# EAGLE schematic ecad-transmitter-v4-transmitter-v4-sch (EAGLE 9.7.0)
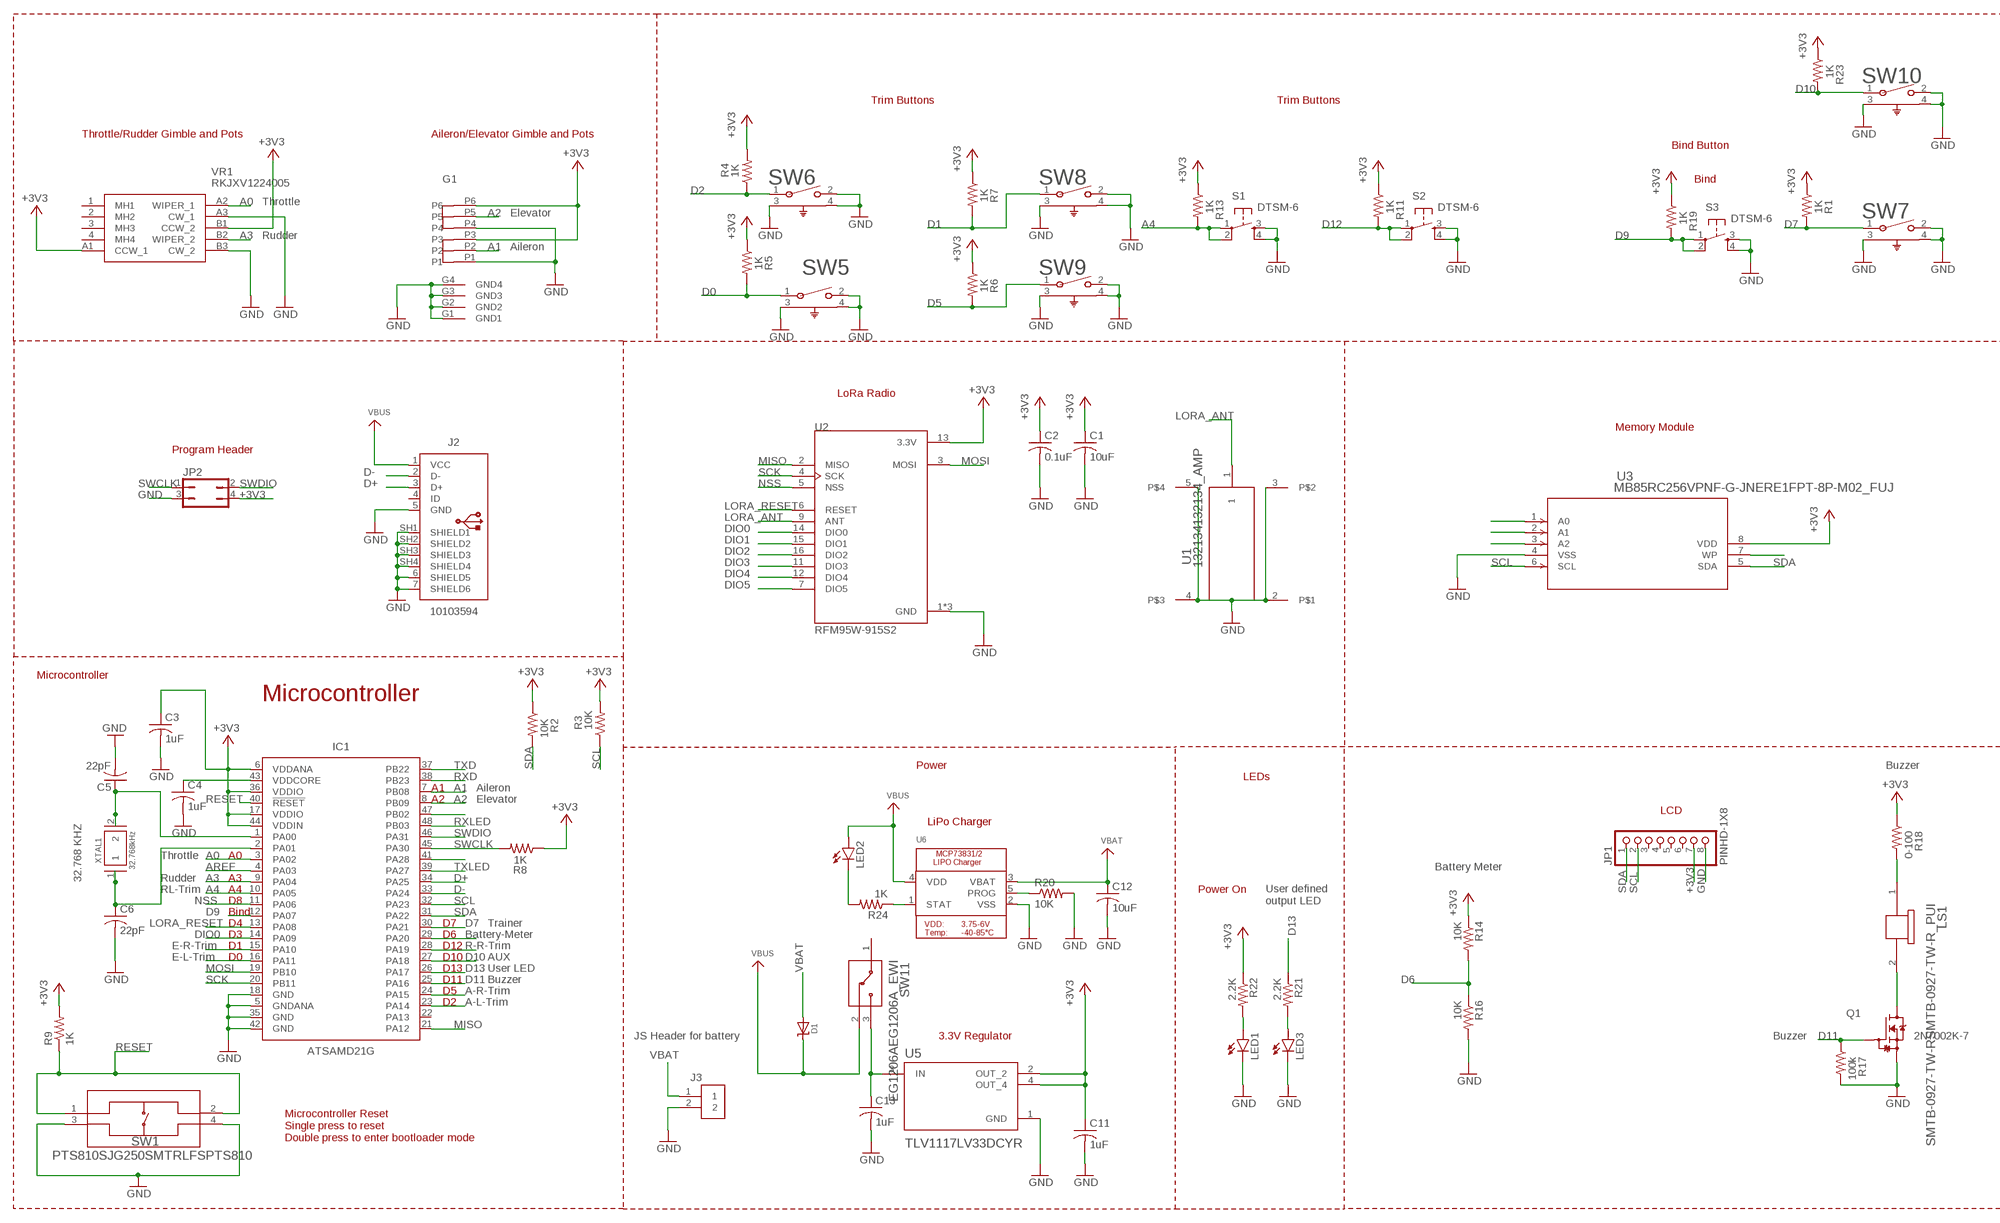
[diagram p0: schematic, sheet 1, part 1 of 2]
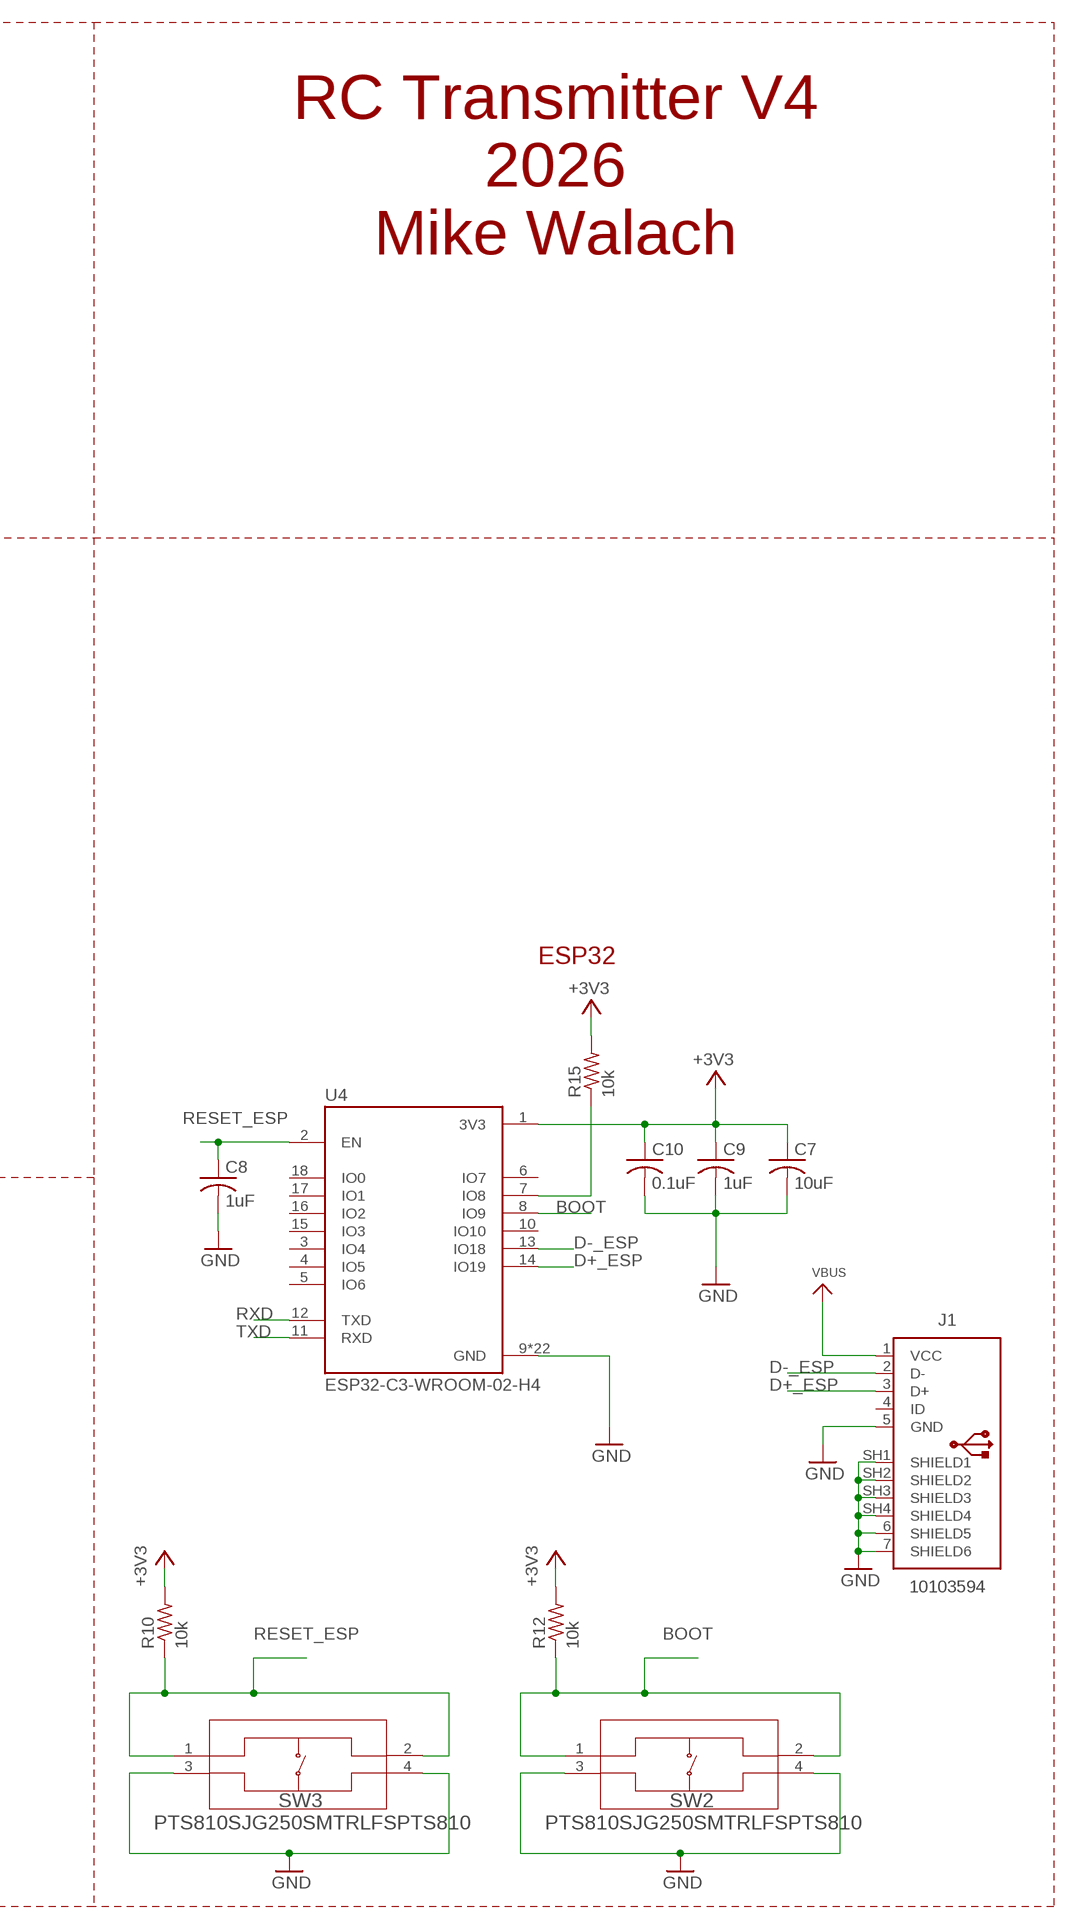
[diagram p1: schematic, sheet 1, part 2 of 2]

## Parts
C1  10uF  C-USC0805  [C0805]
C2  0.1uF  C-USC0805  [C0805]
C3  1uF  C-USC0805  [C0805]
C4  1uF  C-USC0805  [C0805]
C5  22pF  C-USC0805  [C0805]
C6  22pF  C-USC0805  [C0805]
C7  10uF  C-USC0805  [C0805]
C8  1uF  C-USC0805  [C0805]
C9  1uF  C-USC0805  [C0805]
C10  0.1uF  C-USC0805  [C0805]
C11  1uF  C-USC0805  [C0805]
C12  10uF  C-USC0805  [C0805]
C13  1uF  C-USC0805  [C0805]
D1  MICROBUILDER_DIODE-SCHOTTKYSOD-123  [MICROBUILDER_SOD-123]
G1  C37323742  [C37323742]
IC1  ATSAMD21G  ATSAMD21G_TQFP  [QFP50P900X900X120-48]
J1  10103594  [10103594]
J2  10103594  [10103594]
J3  S2B-PH-K-S(LF)(SN)  [S2B-PH-K-S(LF)(SN)]
JP1  PINHD-1X8  [1X08]
JP2  JP2Q  [JP2Q]
LED1  LEDSML0805  [SML0805]
LED2  LEDSML0805  [SML0805]
LED3  LEDSML0805  [SML0805]
LS1  SMTB-0927-TW-RSMTB-0927-TW-R_PUI  [SMTB-0927-TW-R_PUI]
Q1  2N7002K-7  [SOT91P240X110-3N]
R1  1K  R-US_R0805  [R0805]
R2  10K  R-US_R0805  [R0805]
R3  10K  R-US_R0805  [R0805]
R4  1K  R-US_R0805  [R0805]
R5  1K  R-US_R0805  [R0805]
R6  1K  R-US_R0805  [R0805]
R7  1K  R-US_R0805  [R0805]
R8  1K  R-US_R0805  [R0805]
R9  1K  R-US_R0805  [R0805]
R10  10k  R-US_R0805  [R0805]
R11  1K  R-US_R0805  [R0805]
R12  10k  R-US_R0805  [R0805]
R13  1K  R-US_R0805  [R0805]
R14  10K  R-US_R0805  [R0805]
R15  10k  R-US_R0805  [R0805]
R16  10K  R-US_R0805  [R0805]
R17  100k  R-US_R0805  [R0805]
R18  0-100  R-US_R0805  [R0805]
R19  1K  R-US_R0805  [R0805]
R20  10K  R-US_R0805  [R0805]
R21  2.2K  R-US_R0805  [R0805]
R22  2.2K  R-US_R0805  [R0805]
R23  1K  R-US_R0805  [R0805]
R24  1K  R-US_R0805  [R0805]
S1  DTSM-6  [DTSM-6]
S2  DTSM-6  [DTSM-6]
S3  DTSM-6  [DTSM-6]
SW1  PTS810SJG250SMTRLFSPTS810  [PTS810]
SW2  PTS810SJG250SMTRLFSPTS810  [PTS810]
SW3  PTS810SJG250SMTRLFSPTS810  [PTS810]
SW5  1825027-8SW2_1825027-C_TEC  [SW2_1825027-C_TEC]
SW6  1825027-8SW2_1825027-C_TEC  [SW2_1825027-C_TEC]
SW7  1825027-8SW2_1825027-C_TEC  [SW2_1825027-C_TEC]
SW8  1825027-8SW2_1825027-C_TEC  [SW2_1825027-C_TEC]
SW9  1825027-8SW2_1825027-C_TEC  [SW2_1825027-C_TEC]
SW10  1825027-8SW2_1825027-C_TEC  [SW2_1825027-C_TEC]
SW11  EG1206AEG1206A_EWI  [EG1206A_EWI]
U1  132134132134_AMP  [132134_AMP]
U2  RFM95W-915S2  [XCVR_RFM95W-915S2]
U3  MB85RC256VPNF-G-JNERE1FPT-8P-M02_FUJ  [FPT-8P-M02_FUJ]
U4  ESP32-C3-WROOM-02-H4  [MODULE_ESP32-C3-WROOM-02-H4]
U5  TLV1117LV33DCYR  [VREG_TLV1117LV33DCYR]
U6  MICROBUILDER_MCP73831/2  [MICROBUILDER_SOT23-5]
VR1  RKJXV1224005  [RKJXV1224005]
XTAL1  32.768kHz  ABSO7  [XTAL_ABS07-32.768KHZ-T]

## Nets
+3V3: C1.1 C2.1 C3.1 C7.1 C9.1 C10.1 C11.1 G1.P3 G1.P6 IC1.6(VDDANA) IC1.17(VDDIO) IC1.36(VDDIO) IC1.44(VDDIN) JP1.7 JP2.4 R1.1 R2.1 R3.2 R4.2 R5.1 R6.1 R7.1 R8.1 R9.2 R10.2 R11.1 R12.2 R13.1 R14.1 R15.2 R18.1 R19.1 R22.1 R23.1 U2.13(3.3V) U3.8(VDD) U4.1(3V3) U5.2(OUT_2) U5.4(OUT_4) VR1.A1(CCW_1) VR1.B1(CCW_2)
A0: IC1.3(PA02) VR1.A2(WIPER_1)
A1: G1.P2 IC1.7(PB08)
A2: G1.P5 IC1.8(PB09)
A3: IC1.9(PA04) VR1.B2(WIPER_2)
A4: IC1.10(PA05) R13.2 S1.1 S1.2
AREF: IC1.4(PA03)
BOOT: R12.1 SW2.1 SW2.2 U4.8(IO9)
D0: IC1.16(PA11) R5.2 SW5.1
D1: IC1.15(PA10) R7.2 SW8.1
D2: IC1.23(PA14) R4.1 SW6.1
D5: IC1.24(PA15) R6.2 SW9.1
D6: IC1.29(PA20) R14.2 R16.1
D7: IC1.30(PA21) R1.2 SW7.1
D9: IC1.12(PA07) R19.2 S3.1 S3.2
D10: IC1.27(PA18) R23.2 SW10.1
D11: IC1.25(PA16) Q1.1(G) R17.1
D12: IC1.28(PA19) R11.2 S2.1 S2.2
D13: IC1.26(PA17) R21.1
D+: IC1.34(PA25) J2.3(D+)
D+_ESP: J1.3(D+) U4.14(IO19)
D-: IC1.33(PA24) J2.2(D-)
D-_ESP: J1.2(D-) U4.13(IO18)
DIO0: IC1.14(PA09) U2.14(DIO0)
DIO1: U2.15(DIO1)
DIO2: U2.16(DIO2)
DIO3: U2.11(DIO3)
DIO4: U2.12(DIO4)
DIO5: U2.7(DIO5)
GND: C1.2 C2.2 C3.2 C4.2 C5.2 C6.2 C7.2 C8.2 C9.2 C10.2 C11.2 C12.2 C13.2 G1.G1(GND1) G1.G2(GND2) G1.G3(GND3) G1.G4(GND4) G1.P1 G1.P4 IC1.5(GNDANA) IC1.18(GND) IC1.35(GND) IC1.42(GND) J1.5(GND) J1.6(SHIELD5) J1.7(SHIELD6) J1.SH1(SHIELD1) J1.SH2(SHIELD2) J1.SH3(SHIELD3) J1.SH4(SHIELD4) J2.5(GND) J2.6(SHIELD5) J2.7(SHIELD6) J2.SH1(SHIELD1) J2.SH2(SHIELD2) J2.SH3(SHIELD3) J2.SH4(SHIELD4) J3.2 JP1.8 JP2.3 LED1.C LED3.C Q1.2(S) R16.2 R17.2 R20.2 S1.3 S1.4 S2.3 S2.4 S3.3 S3.4 SW1.3 SW1.4 SW2.3 SW2.4 SW3.3 SW3.4 SW5.2 SW5.3 SW5.4 SW6.2 SW6.3 SW6.4 SW7.2 SW7.3 SW7.4 SW8.2 SW8.3 SW8.4 SW9.2 SW9.3 SW9.4 SW10.2 SW10.3 SW10.4 U1.2 U1.3 U1.4 U1.5 U2.1(GND) U2.8(GND) U2.10(GND) U3.4(VSS) U4.9(GND) U4.19(GND) U4.20(GND) U4.21(GND) U4.22(GND) U4.23(GND) U4.24(GND) U4.25(GND) U4.26(GND) U4.27(GND) U4.28(GND) U4.29(GND) U4.30(GND) U4.31(GND) U4.32(GND) U4.33(GND) U4.34(GND) U4.35(GND) U4.36(GND) U4.37(GND) U4.38(GND) U4.39(GND) U5.1(GND) U6.2(VSS) VR1.A3(CW_1) VR1.B3(CW_2)
LORA_ANT: U1.1 U2.9(ANT)
LORA_RESET: IC1.13(PA08) U2.6(RESET)
MISO: IC1.21(PA12) U2.2(MISO)
MOSI: IC1.19(PB10) U2.3(MOSI)
N$1: IC1.47(PB02)
N$2: C4.1 IC1.43(VDDCORE)
N$3: IC1.41(PA28)
N$4: LS1.1 R18.2
N$5: R24.1 U6.1(STAT)
N$6: LS1.2 Q1.3(D)
N$7: LED2.C R24.2
N$8: LED3.A R21.2
N$9: U3.7(WP)
N$10: R20.1 U6.5(PROG)
N$11: U3.3(A2)
N$12: C6.1 IC1.2(PA01) XTAL1.1
N$13: U3.2(A1)
N$14: U3.1(A0)
N$15: C5.1 IC1.1(PA00) XTAL1.2
N$16: C13.1 SW11.3 U5.3(IN)
N$17: R15.1 U4.7(IO8)
N$30: LED1.A R22.2
NSS: IC1.11(PA06) U2.5(NSS)
RESET: IC1.40(!RESET) R9.1 SW1.1 SW1.2
RESET_ESP: C8.1 R10.1 SW3.1 SW3.2 U4.2(EN)
RXD: IC1.38(PB23) U4.12(TXD)
RXLED: IC1.48(PB03)
SCK: IC1.20(PB11) U2.4(SCK)
SCL: IC1.32(PA23) JP1.2 R3.1 U3.6(SCL)
SDA: IC1.31(PA22) JP1.1 R2.2 U3.5(SDA)
SWCLK: IC1.45(PA30) JP2.1 R8.2
SWDIO: IC1.46(PA31) JP2.2
TXD: IC1.37(PB22) U4.11(RXD)
TXLED: IC1.39(PA27)
VBAT: C12.1 D1.A J3.1 U6.3(VBAT)
VBUS: D1.C J1.1(VCC) J2.1(VCC) LED2.A SW11.2 U6.4(VDD)
Unconnected: IC1.22(PA13) J1.4(ID) J2.4(ID) JP1.3 JP1.4 JP1.5 JP1.6 SW11.1 U4.3(IO4) U4.4(IO5) U4.5(IO6) U4.6(IO7) U4.10(IO10) U4.15(IO3) U4.16(IO2) U4.17(IO1) U4.18(IO0) VR1.1(MH1) VR1.2(MH2) VR1.3(MH3) VR1.4(MH4)

## Notes on the sheet
- Trim Buttons | Trim Buttons
- RC Transmitter V4
  2026
  Mike Walach
- Throttle/Rudder Gimble and Pots | Aileron/Elevator Gimble and Pots
- Bind Button
- G1 | Bind
- Throttle
- Elevator
- Rudder
- Aileron
- LoRa Radio
- Memory Module
- Program Header
- ESP32
- Microcontroller
- Microcontroller
- Power | Buzzer
- LEDs
- A1 | Aileron
- A2 | Elevator
- LCD
- LiPo Charger
- Throttle | A0
- Battery Meter
- 32.768 KHZ | Rudder | A3
- RL-Trim | A4 | Power On
- D8
- User defined 
  output LED
- Bind
- D4 | D7 | Trainer
- D3 | D6 | Battery-Meter
- E-R-Trim | D1 | D12 | R-R-Trim
- E-L-Trim | D0 | D10 | AUX
- D13 | User LED
- D11 | Buzzer
- D5 | A-R-Trim
- D2 | A-L-Trim
- JS Header for battery | 3.3V Regulator | Buzzer
- Microcontroller Reset
  Single press to reset
  Double press to enter bootloader mode

## Library data of the parts
C1-C13 = rcl:C-US: CAPACITOR, American symbol; SPICEPREFIX: C
D1 = flightcomputer-2023:MICROBUILDER_DIODE-SCHOTTKY
G1 = C37323742:C37323742
IC1 = IC_Embedded:ATSAMD21G*: 32-bit ARM-Based Microcontrollers Datasheet <http://ww1.microchip.com/downloads/en/devicedoc/40001884a.pdf> Note:For this part User needs to add thermal via in thermal pad in QFN package while designing a board.; CATEGORY: IC_Embedded; CORE: ARM Cortex M0+; DESCRIPTION: Low-power, high-performance Microchip's ARM® Cortex®-M0+ based flash microcontroller; MANUFACTURER: Microchip Technology; MPN: ATSAMD21G; OPERATING_TEMP: variable; PACKAGE: TQFP-48; PART_STATUS: Active; ROHS_COMPLIANT: COMPLIANT; SERIES: SAM D21G; SUB-CATEGORY: Microcontroller; TYPE: 32 bit Microcontroller
J1 J2 = Connector_USB:10103594: USB(2.0) Micro-B, RCPT, 5POS, SMD-THT-R/A Datasheet <https://cdn.amphenol-icc.com/media/wysiwyg/files/documentation/datasheet/inputoutput/io_usb_micro.pdf> Drawing <https://cdn.amphenol-icc.com/media/wysiwyg/files/drawing/10103594.pdf>; CATEGORY: Connectors; CONTACTS: 5; CURRENT-RATING: 1.8A; DESCRIPTION: CONN RCPT USB2.0 MICRO B SMD R/A; GENDER: Receptacle; MANUFACTURER: Amphenol ICC (FCI); MOUNT_TYPE: R/A; MPN: 10103594-0001LF; OPERATING_TEMPERATURE: -30°C ~ 80°C; PART_STATUS: ACTIVE; ROHS_COMPLIANT: COMPLIANT; SUB_CATEGORY: USB; TYPE: USB-micro B; VOLTAGE-RATING: 100VAC
J3 = Connectors:S2B-PH-K-S(LF)(SN): CONN HEADER R/A 2POS 2MM Manufacturer's datasheet <http://www.jst-mfg.com/product/pdf/eng/ePH.pdf>; CREATED_BY: PCBLayout.com; DIGI_KEY_PART_NUMBER: 455-1719-ND; MANUFACTURER: JST Sales America Inc.; MPN: S2B-PH-K-S(LF)(SN)
JP1 = Connector:PINHD-1X8: PIN HEADER; CATEGORY: Headers; DESCRIPTION: Header, Straight, 8 Position; MANUFACTURER: Generic; MPN: Generic; OPERATING_TEMPERATURE: Generic; PART_STATUS: Active; PITCH: 0.100" (2.54mm); ROHS_COMPLIANCE: Generic; SERIES: Generic; SUB-CATEGORY: Headers, Male Pins; TYPE: Board to Board or Cable, Unshrouded, Through Hole, Straight
JP2 = jumper:JP2Q: JUMPER
LED1-LED3 = led:LED: LED OSRAM: - CHIPLED LG R971, LG N971, LY N971, LG Q971, LY Q971, LO R971, LY R971 LH N974, LH R974 LS Q976, LO Q976, LY Q976 LO Q996 - Hyper CHIPLED LW Q18S LB Q993, LB Q99A, LB R99A - SideLED LS A670, LO A670, LY A670, LG A670, LP A670 LB A673, LV A673, LT A673, LW A673 LH A674 LY A675 LS A676, LA A676, LO A676, LY A676, LW A676 LS A679, LY A679, LG A679 - Hyper Micro SIDELED® LS Y876, LA Y876, LO Y876, LY Y876 LT Y87S - SmartLED LW L88C, LW L88S LB L89C, LB L89S, LG L890 LS L89K, LO L89K, LY L89K LS L896, LA L896, LO L896, LY L896 - TOPLED LS T670, LO T670, LY T670, LG T670, LP T670 LSG T670, LSP T670, LSY T670, LOP T670, LYG T670 LG T671, LOG T671, LSG T671 LB T673, LV T673, LT T673, LW T673 LH T674 LS T676, LA T676, LO T676, LY T676, LB T676, LH T676, LSB T676, LW T676 LB T67C, LV T67C, LT T67C, LS T67K, LO T67K, LY T67K, LW E67C LS E67B, LA E67B, LO E67B, LY E67B, LB E67C, LV E67C, LT E67C LW T67C LS T679, LY T679, LG T679 LS T770, LO T770, LY T770, LG T770, LP T770 LB T773, LV T773, LT T773, LW T773 LH T774 LS E675, LA E675, LY E675, LS T675 LS T776, LA T776, LO T776, LY T776, LB T776 LHGB T686 LT T68C, LB T68C - Hyper Mini TOPLED® LB M676 - Mini TOPLED Santana® LG M470 LS M47K, LO M47K, LY M47K Source: http://www.osram.convergy.de LUXEON: - LUMILED® LXK2-PW12-R00, LXK2-PW12-S00, LXK2-PW14-U00, LXK2-PW14-V00 LXK2-PM12-R00, LXK2-PM12-S00, LXK2-PM14-U00 LXK2-PE12-Q00, LXK2-PE12-R00, LXK2-PE12-S00, LXK2-PE14-T00, LXK2-PE14-U00 LXK2-PB12-K00, LXK2-PB12-L00, LXK2-PB12-M00, LXK2-PB14-N00, LXK2-PB14-P00, LXK2-PB14-Q00 LXK2-PR12-L00, LXK2-PR12-M00, LXK2-PR14-Q00, LXK2-PR14-R00 LXK2-PD12-Q00, LXK2-PD12-R00, LXK2-PD12-S00 LXK2-PH12-R00, LXK2-PH12-S00 LXK2-PL12-P00, LXK2-PL12-Q00, LXK2-PL12-R00 Source: www.luxeon.com KINGBRIGHT: KA-3528ASYC Source: www.kingbright.com
LS1 = 2026-06-20_23-40-30_Library:SMTB-0927-TW-R; COPYRIGHT: Copyright (C) 2026 Ultra Librarian. All rights reserved.; MANUFACTURER_NAME: PUI Audio; MANUFACTURER_PART_NUMBER: SMTB-0927-TW-R
Q1 = 2N7002K-7:2N7002K-7: 2N7002K Series 60 V 2 Ohm SMT N-Channel Enhancement Mode Mosfet - SOT-23-3; MANUFACTURER: Diodes Inc.; MAXIMUM_PACKAGE_HIEGHT: 1.1mm; PARTREV: 15-2; STANDARD: IPC7351B
R1-R24 = rcl:R-US_: RESISTOR, American symbol; SPICEPREFIX: R
S1-S3 = switch-tact:DTSM-6
SW1-SW3 = 2024-06-17_17-27-14_Library:PTS810SJG250SMTRLFS; COPYRIGHT: Copyright (C) 2024 Ultra Librarian. All rights reserved.; MANUFACTURER_PART_NUMBER: PTS810SJG250SMTRLFS; MFR_NAME: C&K Components
SW5-SW10 = 1825027-8:1825027-8; COPYRIGHT: Copyright (C) 2026 Ultra Librarian. All rights reserved.; DESCRIPTION: FSMRA3JH04=R/A,TACT PB SW,160G; MANUFACTURER_NAME: TE Connectivity; MANUFACTURER_PART_NUMBER: 1825027-8
SW11 = EG1206A-plated-slots:EG1206A; COPYRIGHT: Copyright (C) 2026 Ultra Librarian. All rights reserved.; MANUFACTURER_NAME: E-Switch; MANUFACTURER_PART_NUMBER: EG1206A
U1 = 2025-03-19_02-22-58_Library:132134; COPYRIGHT: Copyright (C) 2025 Ultra Librarian. All rights reserved.; MANUFACTURER_PART_NUMBER: 132134; MFR_NAME: Amphenol ICC
U2 = RFM95W-915S2:RFM95W-915S2: Check availability <https://pricing.snapeda.com/parts/RFM95W-915S2/RF%20Solutions/view-part?ref=eda>; AVAILABILITY: In Stock; CHECK_PRICES: https://www.snapeda.com/parts/RFM95W-915S2/RF/view-part/?ref=eda; DESCRIPTION: 802.15.4 LoRa™ Transceiver Module 915MHz Antenna Not Included Surface Mount; MF: RF Solutions; MP: RFM95W-915S2; PACKAGE: Non Standard RF Solutions; PRICE: None; PURCHASE-URL: https://www.snapeda.com/api/url_track_click_mouser/?unipart_id=585488&manufacturer=RF Solutions&part_name=RFM95W-915S2&search_term=None; SNAPEDA_LINK: https://www.snapeda.com/parts/RFM95W-915S2/RF/view-part/?ref=snap
U3 = 2025-09-02_13-41-18_Library:MB85RC256VPNF-G-JNERE1; COPYRIGHT: Copyright (C) 2025 Ultra Librarian. All rights reserved.; MANUFACTURER_NAME: Fujitsu Semiconductor; MANUFACTURER_PART_NUMBER: MB85RC256VPNF-G-JNERE1
U4 = ESP32-C3-WROOM-02-H4:ESP32-C3-WROOM-02-H4: Check availability <https://pricing.snapeda.com/parts/ESP32-C3-WROOM-02-H4/Espressif%20Systems/view-part?ref=eda>; AVAILABILITY: In Stock; DESCRIPTION: WiFi Modules (802.11) (Engineering Samples) SMD module, ESP32-C3, 4MB SPI flash, PCB antenna, -40 C +105 C; MF: Espressif Systems; MP: ESP32-C3-WROOM-02-H4; PACKAGE: Package; PRICE: None; PURCHASE-URL: https://pricing.snapeda.com/search/part/ESP32-C3-WROOM-02-H4/?ref=eda
U5 = TLV1117LV33DCYR:TLV1117LV33DCYR; MANUFACTURER: Texas Instruments; MAXIMUM_PACKAGE_HEIGHT: 1.80 mm; PARTREV: B; STANDARD: IPC-7351B
U6 = flightcomputer-2023:MICROBUILDER_MCP73831/2: MCP73831/2 LIPO Charger VDD: 3.75 - 6V Temp -40 - 85°C Programmable Charge Rate: 15-500mA NOTE: STAT is a tri-state logic output on the MCP73831 and an open-drain output on the MCP73832. SOT23-5 with 4.2V output and tri-state logic on STAT = MCP73831T-2ACI/OT
VR1 = RKJXV1224005:RKJXV1224005: Plugin,13x13mm Multi-Directional Switches ROHS, Rotary Potentiometer, 10 kOhm, 1Turn, 12.5 mW Source: Datasheet <https://tech.alpsalpine.com/e/products/detail/RKJXV1224005/>; DESCRIPTION: Plugin,13x13mm Multi-Directional Switches ROHS, Rotary Potentiometer, 10 kOhm, 1Turn, 12.5 mW; HEIGHT: 18.95mm; MANUFACTURER_NAME: ALPS Electric; MANUFACTURER_PART_NUMBER: RKJXV1224005; MOUSER_PART_NUMBER: 688-RKJXV1224005; MOUSER_PRICE-STOCK: https://www.mouser.co.uk/ProductDetail/Alps-Alpine/RKJXV1224005?qs=RiQAlOPxzzAqLSX9lUzx8Q%3D%3D
XTAL1 = Crystal-WA:ABSO7: CRYSTAL 32.7680KHZ 12.5PF SMD Datasheet <https://abracon.com/Resonators/ABS07.pdf>; CATEGORY: Crystal; MANUFACTURER: Abracon LLC; MPN: ABS07-32.768KHZ-T; OPERATING_TEMPERATURE: -40°C ~ 85°C; PART_STATUS: ACTIVE; ROHS_COMPLIANT: COMPLIANT; SERIES: ABS07; SUB_CATEGORY: Crystal Surface Mount; TYPE: Crystal